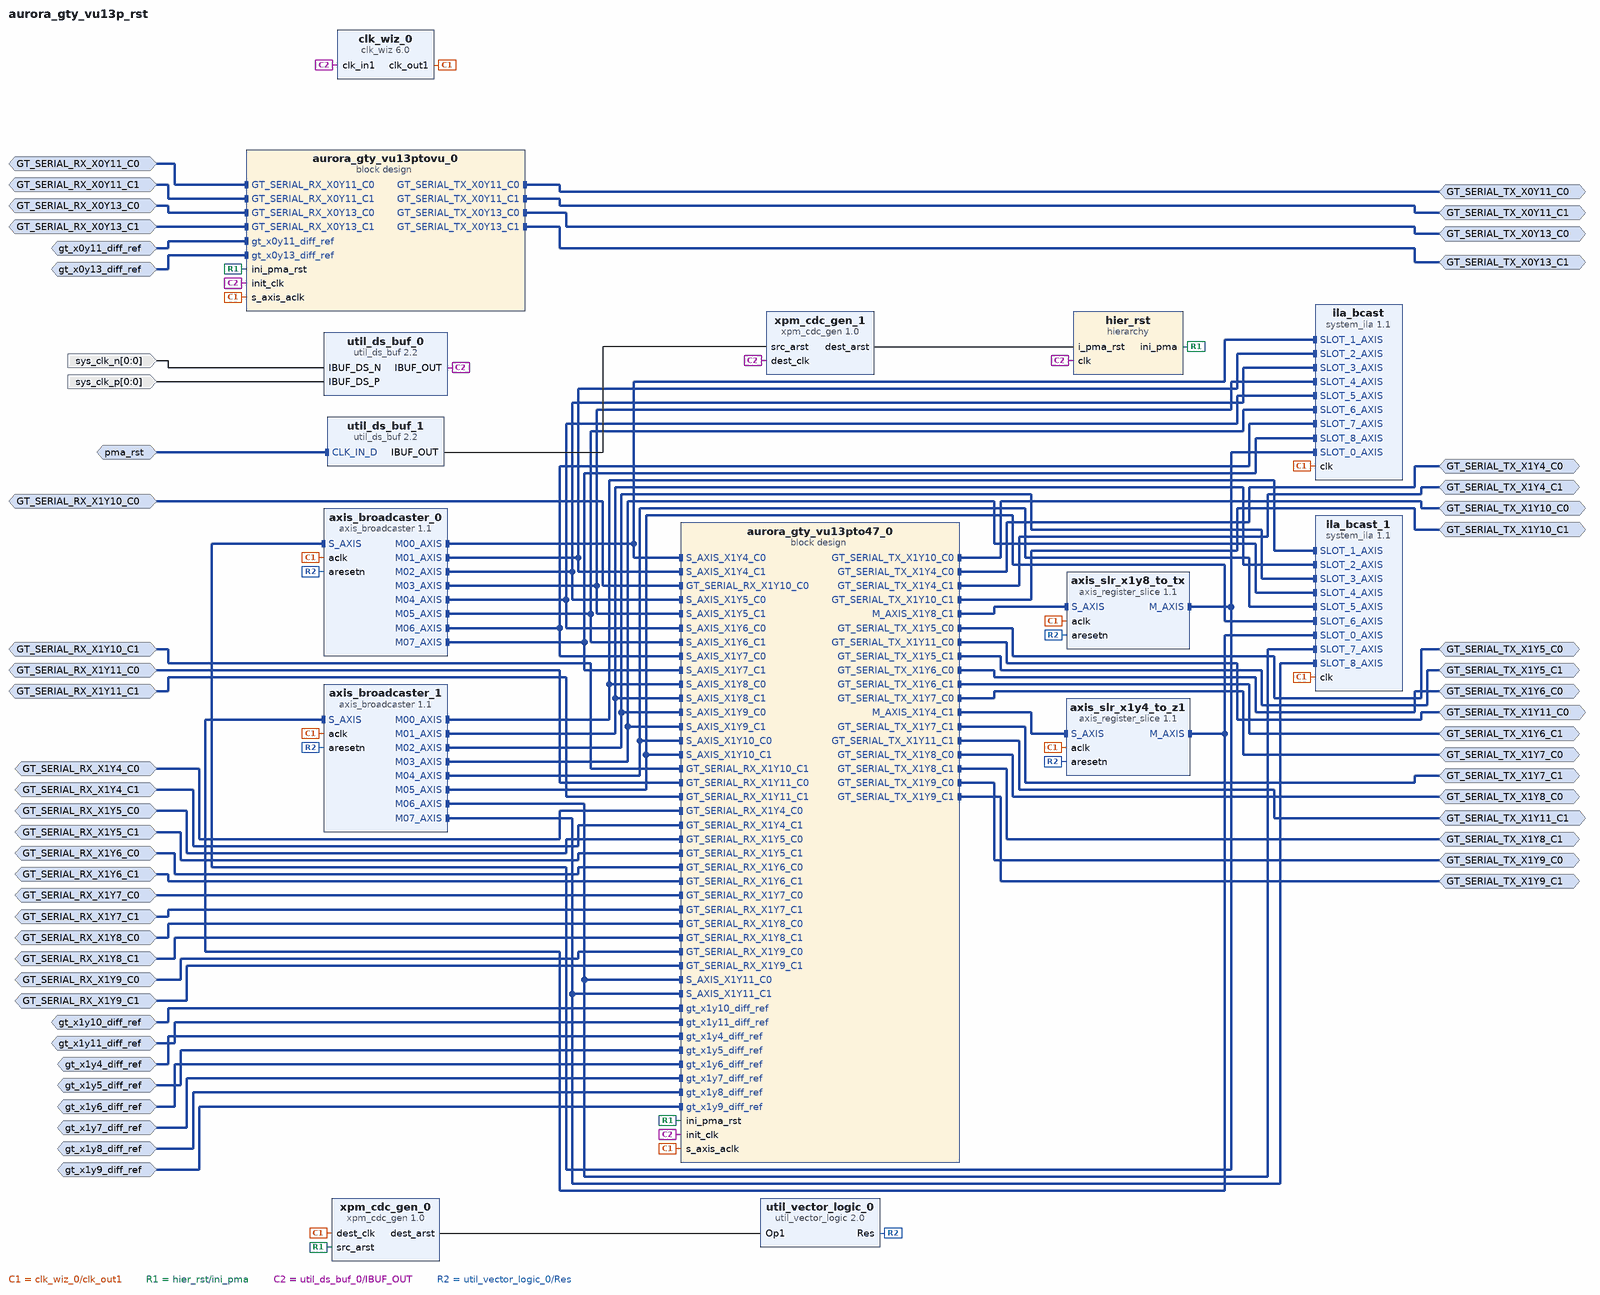
[diagram p0: block diagram of the top level]
# Vivado block design aurora_gty_vu13p_rst, xcvu13p-fhgb2104-2-i, Vivado 2025.2
create_bd_design aurora_gty_vu13p_rst

create_bd_intf_port -mode Slave -vlnv xilinx.com:interface:diff_clock_rtl:1.0 gt_x1y4_diff_ref
set_property -dict {CONFIG.FREQ_HZ 156250000} [get_bd_intf_ports gt_x1y4_diff_ref]
create_bd_intf_port -mode Slave -vlnv xilinx.com:interface:diff_clock_rtl:1.0 gt_x1y8_diff_ref
set_property -dict {CONFIG.FREQ_HZ 156250000} [get_bd_intf_ports gt_x1y8_diff_ref]
create_bd_intf_port -mode Slave -vlnv xilinx.com:display_aurora64b66b:GT_Serial_Transceiver_Pins_RX_rtl:1.0 GT_SERIAL_RX_X1Y8_C0
create_bd_intf_port -mode Slave -vlnv xilinx.com:display_aurora64b66b:GT_Serial_Transceiver_Pins_RX_rtl:1.0 GT_SERIAL_RX_X1Y4_C0
create_bd_intf_port -mode Slave -vlnv xilinx.com:display_aurora64b66b:GT_Serial_Transceiver_Pins_RX_rtl:1.0 GT_SERIAL_RX_X1Y4_C1
create_bd_intf_port -mode Master -vlnv xilinx.com:display_aurora64b66b:GT_Serial_Transceiver_Pins_TX_rtl:1.0 GT_SERIAL_TX_X1Y8_C0
create_bd_intf_port -mode Master -vlnv xilinx.com:display_aurora64b66b:GT_Serial_Transceiver_Pins_TX_rtl:1.0 GT_SERIAL_TX_X1Y4_C0
create_bd_intf_port -mode Master -vlnv xilinx.com:display_aurora64b66b:GT_Serial_Transceiver_Pins_TX_rtl:1.0 GT_SERIAL_TX_X1Y4_C1
create_bd_intf_port -mode Slave -vlnv xilinx.com:display_aurora64b66b:GT_Serial_Transceiver_Pins_RX_rtl:1.0 GT_SERIAL_RX_X0Y11_C1
create_bd_intf_port -mode Slave -vlnv xilinx.com:display_aurora64b66b:GT_Serial_Transceiver_Pins_RX_rtl:1.0 GT_SERIAL_RX_X0Y11_C0
create_bd_intf_port -mode Master -vlnv xilinx.com:display_aurora64b66b:GT_Serial_Transceiver_Pins_TX_rtl:1.0 GT_SERIAL_TX_X0Y13_C1
create_bd_intf_port -mode Master -vlnv xilinx.com:display_aurora64b66b:GT_Serial_Transceiver_Pins_TX_rtl:1.0 GT_SERIAL_TX_X0Y13_C0
create_bd_intf_port -mode Slave -vlnv xilinx.com:display_aurora64b66b:GT_Serial_Transceiver_Pins_RX_rtl:1.0 GT_SERIAL_RX_X0Y13_C0
create_bd_intf_port -mode Master -vlnv xilinx.com:display_aurora64b66b:GT_Serial_Transceiver_Pins_TX_rtl:1.0 GT_SERIAL_TX_X0Y11_C0
create_bd_intf_port -mode Slave -vlnv xilinx.com:interface:diff_clock_rtl:1.0 gt_x0y11_diff_ref
set_property -dict {CONFIG.FREQ_HZ 156250000} [get_bd_intf_ports gt_x0y11_diff_ref]
create_bd_intf_port -mode Slave -vlnv xilinx.com:display_aurora64b66b:GT_Serial_Transceiver_Pins_RX_rtl:1.0 GT_SERIAL_RX_X0Y13_C1
create_bd_intf_port -mode Master -vlnv xilinx.com:display_aurora64b66b:GT_Serial_Transceiver_Pins_TX_rtl:1.0 GT_SERIAL_TX_X0Y11_C1
create_bd_intf_port -mode Slave -vlnv xilinx.com:interface:diff_clock_rtl:1.0 gt_x0y13_diff_ref
set_property -dict {CONFIG.FREQ_HZ 156250000} [get_bd_intf_ports gt_x0y13_diff_ref]
create_bd_intf_port -mode Slave -vlnv xilinx.com:interface:diff_clock_rtl:1.0 pma_rst
create_bd_intf_port -mode Slave -vlnv xilinx.com:interface:diff_clock_rtl:1.0 gt_x1y5_diff_ref
set_property -dict {CONFIG.FREQ_HZ 156250000} [get_bd_intf_ports gt_x1y5_diff_ref]
create_bd_intf_port -mode Slave -vlnv xilinx.com:display_aurora64b66b:GT_Serial_Transceiver_Pins_RX_rtl:1.0 GT_SERIAL_RX_X1Y5_C0
create_bd_intf_port -mode Slave -vlnv xilinx.com:display_aurora64b66b:GT_Serial_Transceiver_Pins_RX_rtl:1.0 GT_SERIAL_RX_X1Y5_C1
create_bd_intf_port -mode Master -vlnv xilinx.com:display_aurora64b66b:GT_Serial_Transceiver_Pins_TX_rtl:1.0 GT_SERIAL_TX_X1Y5_C0
create_bd_intf_port -mode Master -vlnv xilinx.com:display_aurora64b66b:GT_Serial_Transceiver_Pins_TX_rtl:1.0 GT_SERIAL_TX_X1Y5_C1
create_bd_intf_port -mode Slave -vlnv xilinx.com:interface:diff_clock_rtl:1.0 gt_x1y6_diff_ref
set_property -dict {CONFIG.FREQ_HZ 156250000} [get_bd_intf_ports gt_x1y6_diff_ref]
create_bd_intf_port -mode Slave -vlnv xilinx.com:display_aurora64b66b:GT_Serial_Transceiver_Pins_RX_rtl:1.0 GT_SERIAL_RX_X1Y6_C0
create_bd_intf_port -mode Slave -vlnv xilinx.com:display_aurora64b66b:GT_Serial_Transceiver_Pins_RX_rtl:1.0 GT_SERIAL_RX_X1Y6_C1
create_bd_intf_port -mode Master -vlnv xilinx.com:display_aurora64b66b:GT_Serial_Transceiver_Pins_TX_rtl:1.0 GT_SERIAL_TX_X1Y6_C0
create_bd_intf_port -mode Master -vlnv xilinx.com:display_aurora64b66b:GT_Serial_Transceiver_Pins_TX_rtl:1.0 GT_SERIAL_TX_X1Y6_C1
create_bd_intf_port -mode Slave -vlnv xilinx.com:interface:diff_clock_rtl:1.0 gt_x1y7_diff_ref
set_property -dict {CONFIG.FREQ_HZ 156250000} [get_bd_intf_ports gt_x1y7_diff_ref]
create_bd_intf_port -mode Slave -vlnv xilinx.com:display_aurora64b66b:GT_Serial_Transceiver_Pins_RX_rtl:1.0 GT_SERIAL_RX_X1Y7_C0
create_bd_intf_port -mode Slave -vlnv xilinx.com:display_aurora64b66b:GT_Serial_Transceiver_Pins_RX_rtl:1.0 GT_SERIAL_RX_X1Y7_C1
create_bd_intf_port -mode Master -vlnv xilinx.com:display_aurora64b66b:GT_Serial_Transceiver_Pins_TX_rtl:1.0 GT_SERIAL_TX_X1Y7_C0
create_bd_intf_port -mode Master -vlnv xilinx.com:display_aurora64b66b:GT_Serial_Transceiver_Pins_TX_rtl:1.0 GT_SERIAL_TX_X1Y7_C1
create_bd_intf_port -mode Slave -vlnv xilinx.com:display_aurora64b66b:GT_Serial_Transceiver_Pins_RX_rtl:1.0 GT_SERIAL_RX_X1Y10_C0
create_bd_intf_port -mode Slave -vlnv xilinx.com:display_aurora64b66b:GT_Serial_Transceiver_Pins_RX_rtl:1.0 GT_SERIAL_RX_X1Y11_C0
create_bd_intf_port -mode Slave -vlnv xilinx.com:display_aurora64b66b:GT_Serial_Transceiver_Pins_RX_rtl:1.0 GT_SERIAL_RX_X1Y9_C0
create_bd_intf_port -mode Slave -vlnv xilinx.com:display_aurora64b66b:GT_Serial_Transceiver_Pins_RX_rtl:1.0 GT_SERIAL_RX_X1Y10_C1
create_bd_intf_port -mode Slave -vlnv xilinx.com:display_aurora64b66b:GT_Serial_Transceiver_Pins_RX_rtl:1.0 GT_SERIAL_RX_X1Y11_C1
create_bd_intf_port -mode Slave -vlnv xilinx.com:display_aurora64b66b:GT_Serial_Transceiver_Pins_RX_rtl:1.0 GT_SERIAL_RX_X1Y8_C1
create_bd_intf_port -mode Slave -vlnv xilinx.com:display_aurora64b66b:GT_Serial_Transceiver_Pins_RX_rtl:1.0 GT_SERIAL_RX_X1Y9_C1
create_bd_intf_port -mode Master -vlnv xilinx.com:display_aurora64b66b:GT_Serial_Transceiver_Pins_TX_rtl:1.0 GT_SERIAL_TX_X1Y10_C0
create_bd_intf_port -mode Master -vlnv xilinx.com:display_aurora64b66b:GT_Serial_Transceiver_Pins_TX_rtl:1.0 GT_SERIAL_TX_X1Y11_C0
create_bd_intf_port -mode Master -vlnv xilinx.com:display_aurora64b66b:GT_Serial_Transceiver_Pins_TX_rtl:1.0 GT_SERIAL_TX_X1Y9_C0
create_bd_intf_port -mode Master -vlnv xilinx.com:display_aurora64b66b:GT_Serial_Transceiver_Pins_TX_rtl:1.0 GT_SERIAL_TX_X1Y10_C1
create_bd_intf_port -mode Master -vlnv xilinx.com:display_aurora64b66b:GT_Serial_Transceiver_Pins_TX_rtl:1.0 GT_SERIAL_TX_X1Y11_C1
create_bd_intf_port -mode Master -vlnv xilinx.com:display_aurora64b66b:GT_Serial_Transceiver_Pins_TX_rtl:1.0 GT_SERIAL_TX_X1Y8_C1
create_bd_intf_port -mode Master -vlnv xilinx.com:display_aurora64b66b:GT_Serial_Transceiver_Pins_TX_rtl:1.0 GT_SERIAL_TX_X1Y9_C1
create_bd_intf_port -mode Slave -vlnv xilinx.com:interface:diff_clock_rtl:1.0 gt_x1y10_diff_ref
set_property -dict {CONFIG.FREQ_HZ 156250000} [get_bd_intf_ports gt_x1y10_diff_ref]
create_bd_intf_port -mode Slave -vlnv xilinx.com:interface:diff_clock_rtl:1.0 gt_x1y11_diff_ref
set_property -dict {CONFIG.FREQ_HZ 156250000} [get_bd_intf_ports gt_x1y11_diff_ref]
create_bd_intf_port -mode Slave -vlnv xilinx.com:interface:diff_clock_rtl:1.0 gt_x1y9_diff_ref
set_property -dict {CONFIG.FREQ_HZ 156250000} [get_bd_intf_ports gt_x1y9_diff_ref]
create_bd_port -dir I -from 0 -to 0 -type clk sys_clk_n
create_bd_port -dir I -from 0 -to 0 -type clk sys_clk_p

create_bd_cell -type hier hier_rst
create_bd_cell -type ip -vlnv xilinx.com:ip:util_ds_buf:2.2 util_ds_buf_0
create_bd_cell -type container -reference aurora_gty_vu13pto47dr aurora_gty_vu13pto47_0
set_property -dict [list \
  CONFIG.ACTIVE_SIM_BD aurora_gty_vu13pto47dr.bd \
  CONFIG.ACTIVE_SYNTH_BD aurora_gty_vu13pto47dr.bd \
  CONFIG.ENABLE_DFX 0 \
  CONFIG.LIST_SIM_BD aurora_gty_vu13pto47dr.bd \
  CONFIG.LIST_SYNTH_BD aurora_gty_vu13pto47dr.bd \
  CONFIG.LOCK_PROPAGATE 0 \
] [get_bd_cells aurora_gty_vu13pto47_0]
create_bd_cell -type ip -vlnv xilinx.com:ip:axis_broadcaster:1.1 axis_broadcaster_0
set_property -dict [list \
  CONFIG.HAS_TKEEP 1 \
  CONFIG.HAS_TLAST 1 \
  CONFIG.HAS_TREADY 0 \
  CONFIG.HAS_TSTRB 0 \
  CONFIG.M_TDATA_NUM_BYTES 16 \
  CONFIG.M_TUSER_WIDTH 0 \
  CONFIG.NUM_MI 8 \
  CONFIG.S_TDATA_NUM_BYTES 16 \
  CONFIG.S_TUSER_WIDTH 0 \
  CONFIG.TDEST_WIDTH 0 \
  CONFIG.TID_WIDTH 0 \
] [get_bd_cells axis_broadcaster_0]
create_bd_cell -type ip -vlnv xilinx.com:ip:xpm_cdc_gen:1.0 xpm_cdc_gen_0
set_property -dict {CONFIG.CDC_TYPE xpm_cdc_async_rst} [get_bd_cells xpm_cdc_gen_0]
create_bd_cell -type ip -vlnv xilinx.com:ip:util_vector_logic:2.0 util_vector_logic_0
set_property -dict {CONFIG.C_OPERATION not CONFIG.C_SIZE 1} [get_bd_cells util_vector_logic_0]
create_bd_cell -type ip -vlnv xilinx.com:ip:clk_wiz:6.0 clk_wiz_0
set_property -dict [list \
  CONFIG.CLKOUT1_JITTER 90.074 \
  CONFIG.CLKOUT1_REQUESTED_OUT_FREQ 400.000 \
  CONFIG.MMCM_CLKOUT0_DIVIDE_F 3.000 \
  CONFIG.USE_LOCKED false \
  CONFIG.USE_RESET false \
] [get_bd_cells clk_wiz_0]
create_bd_cell -type container -reference aurora_gty_vu13ptovu13p aurora_gty_vu13ptovu_0
set_property -dict [list \
  CONFIG.ACTIVE_SIM_BD aurora_gty_vu13ptovu13p.bd \
  CONFIG.ACTIVE_SYNTH_BD aurora_gty_vu13ptovu13p.bd \
  CONFIG.ENABLE_DFX 0 \
  CONFIG.LIST_SIM_BD aurora_gty_vu13ptovu13p.bd \
  CONFIG.LIST_SYNTH_BD aurora_gty_vu13ptovu13p.bd \
  CONFIG.LOCK_PROPAGATE 0 \
] [get_bd_cells aurora_gty_vu13ptovu_0]
create_bd_cell -type ip -vlnv xilinx.com:ip:util_ds_buf:2.2 util_ds_buf_1
create_bd_cell -type ip -vlnv xilinx.com:ip:xpm_cdc_gen:1.0 xpm_cdc_gen_1
set_property -dict {CONFIG.CDC_TYPE xpm_cdc_async_rst} [get_bd_cells xpm_cdc_gen_1]
create_bd_cell -type ip -vlnv xilinx.com:ip:axis_register_slice:1.1 axis_slr_x1y8_to_tx
set_property -dict [list \
  CONFIG.NUM_SLR_CROSSINGS 1 \
  CONFIG.PIPELINES_MASTER 1 \
  CONFIG.PIPELINES_SLAVE 1 \
  CONFIG.REG_CONFIG 15 \
] [get_bd_cells axis_slr_x1y8_to_tx]
create_bd_cell -type ip -vlnv xilinx.com:ip:system_ila:1.1 ila_bcast
set_property -dict [list \
  CONFIG.C_DATA_DEPTH 1024 \
  CONFIG.C_MON_TYPE INTERFACE \
  CONFIG.C_NUM_MONITOR_SLOTS 9 \
  CONFIG.C_SLOT_0_INTF_TYPE xilinx.com:interface:axis_rtl:1.0 \
  CONFIG.C_SLOT_1_INTF_TYPE xilinx.com:interface:axis_rtl:1.0 \
  CONFIG.C_SLOT_2_INTF_TYPE xilinx.com:interface:axis_rtl:1.0 \
  CONFIG.C_SLOT_3_INTF_TYPE xilinx.com:interface:axis_rtl:1.0 \
  CONFIG.C_SLOT_4_INTF_TYPE xilinx.com:interface:axis_rtl:1.0 \
  CONFIG.C_SLOT_5_INTF_TYPE xilinx.com:interface:axis_rtl:1.0 \
  CONFIG.C_SLOT_6_INTF_TYPE xilinx.com:interface:axis_rtl:1.0 \
  CONFIG.C_SLOT_7_INTF_TYPE xilinx.com:interface:axis_rtl:1.0 \
  CONFIG.C_SLOT_8_INTF_TYPE xilinx.com:interface:axis_rtl:1.0 \
] [get_bd_cells ila_bcast]
create_bd_cell -type ip -vlnv xilinx.com:ip:axis_register_slice:1.1 axis_slr_x1y4_to_z1
set_property -dict [list \
  CONFIG.NUM_SLR_CROSSINGS 1 \
  CONFIG.PIPELINES_MASTER 1 \
  CONFIG.PIPELINES_SLAVE 1 \
  CONFIG.REG_CONFIG 15 \
] [get_bd_cells axis_slr_x1y4_to_z1]
create_bd_cell -type ip -vlnv xilinx.com:ip:axis_broadcaster:1.1 axis_broadcaster_1
set_property -dict [list \
  CONFIG.HAS_TKEEP 1 \
  CONFIG.HAS_TLAST 1 \
  CONFIG.HAS_TREADY 0 \
  CONFIG.HAS_TSTRB 0 \
  CONFIG.M_TDATA_NUM_BYTES 16 \
  CONFIG.M_TUSER_WIDTH 0 \
  CONFIG.NUM_MI 8 \
  CONFIG.S_TDATA_NUM_BYTES 16 \
  CONFIG.S_TUSER_WIDTH 0 \
  CONFIG.TDEST_WIDTH 0 \
  CONFIG.TID_WIDTH 0 \
] [get_bd_cells axis_broadcaster_1]
create_bd_cell -type ip -vlnv xilinx.com:ip:system_ila:1.1 ila_bcast_1
set_property -dict [list \
  CONFIG.C_DATA_DEPTH 1024 \
  CONFIG.C_MON_TYPE INTERFACE \
  CONFIG.C_NUM_MONITOR_SLOTS 9 \
  CONFIG.C_SLOT_0_INTF_TYPE xilinx.com:interface:axis_rtl:1.0 \
  CONFIG.C_SLOT_1_INTF_TYPE xilinx.com:interface:axis_rtl:1.0 \
  CONFIG.C_SLOT_2_INTF_TYPE xilinx.com:interface:axis_rtl:1.0 \
  CONFIG.C_SLOT_3_INTF_TYPE xilinx.com:interface:axis_rtl:1.0 \
  CONFIG.C_SLOT_4_INTF_TYPE xilinx.com:interface:axis_rtl:1.0 \
  CONFIG.C_SLOT_5_INTF_TYPE xilinx.com:interface:axis_rtl:1.0 \
  CONFIG.C_SLOT_6_INTF_TYPE xilinx.com:interface:axis_rtl:1.0 \
  CONFIG.C_SLOT_7_INTF_TYPE xilinx.com:interface:axis_rtl:1.0 \
  CONFIG.C_SLOT_8_INTF_TYPE xilinx.com:interface:axis_rtl:1.0 \
] [get_bd_cells ila_bcast_1]

# ---- hierarchy /hier_rst ----
current_bd_instance /hier_rst
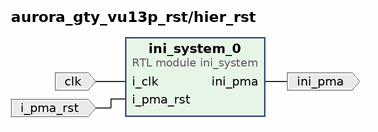
[diagram p1: block diagram inside /hier_rst]
create_bd_pin -dir I -type clk clk
create_bd_pin -dir O ini_pma
create_bd_pin -dir I -type rst i_pma_rst

create_bd_cell -type module -reference ini_system ini_system_0

# ---- connections ----

current_bd_instance /hier_rst
connect_bd_net [get_bd_pins clk] [get_bd_pins ini_system_0/i_clk]
connect_bd_net [get_bd_pins i_pma_rst] [get_bd_pins ini_system_0/i_pma_rst]
connect_bd_net [get_bd_pins ini_system_0/ini_pma] [get_bd_pins ini_pma]

current_bd_instance /
connect_bd_intf_net [get_bd_intf_ports GT_SERIAL_RX_X0Y11_C0] [get_bd_intf_pins aurora_gty_vu13ptovu_0/GT_SERIAL_RX_X0Y11_C0]
connect_bd_intf_net [get_bd_intf_ports GT_SERIAL_RX_X0Y11_C1] [get_bd_intf_pins aurora_gty_vu13ptovu_0/GT_SERIAL_RX_X0Y11_C1]
connect_bd_intf_net [get_bd_intf_ports GT_SERIAL_RX_X0Y13_C0] [get_bd_intf_pins aurora_gty_vu13ptovu_0/GT_SERIAL_RX_X0Y13_C0]
connect_bd_intf_net [get_bd_intf_ports GT_SERIAL_RX_X0Y13_C1] [get_bd_intf_pins aurora_gty_vu13ptovu_0/GT_SERIAL_RX_X0Y13_C1]
connect_bd_intf_net [get_bd_intf_ports GT_SERIAL_RX_X1Y10_C0] [get_bd_intf_pins aurora_gty_vu13pto47_0/GT_SERIAL_RX_X1Y10_C0]
connect_bd_intf_net [get_bd_intf_ports GT_SERIAL_RX_X1Y10_C1] [get_bd_intf_pins aurora_gty_vu13pto47_0/GT_SERIAL_RX_X1Y10_C1]
connect_bd_intf_net [get_bd_intf_ports GT_SERIAL_RX_X1Y11_C0] [get_bd_intf_pins aurora_gty_vu13pto47_0/GT_SERIAL_RX_X1Y11_C0]
connect_bd_intf_net [get_bd_intf_ports GT_SERIAL_RX_X1Y11_C1] [get_bd_intf_pins aurora_gty_vu13pto47_0/GT_SERIAL_RX_X1Y11_C1]
connect_bd_intf_net [get_bd_intf_ports GT_SERIAL_RX_X1Y4_C0] [get_bd_intf_pins aurora_gty_vu13pto47_0/GT_SERIAL_RX_X1Y4_C0]
connect_bd_intf_net [get_bd_intf_ports GT_SERIAL_RX_X1Y4_C1] [get_bd_intf_pins aurora_gty_vu13pto47_0/GT_SERIAL_RX_X1Y4_C1]
connect_bd_intf_net [get_bd_intf_ports GT_SERIAL_RX_X1Y5_C0] [get_bd_intf_pins aurora_gty_vu13pto47_0/GT_SERIAL_RX_X1Y5_C0]
connect_bd_intf_net [get_bd_intf_ports GT_SERIAL_RX_X1Y5_C1] [get_bd_intf_pins aurora_gty_vu13pto47_0/GT_SERIAL_RX_X1Y5_C1]
connect_bd_intf_net [get_bd_intf_ports GT_SERIAL_RX_X1Y6_C0] [get_bd_intf_pins aurora_gty_vu13pto47_0/GT_SERIAL_RX_X1Y6_C0]
connect_bd_intf_net [get_bd_intf_ports GT_SERIAL_RX_X1Y6_C1] [get_bd_intf_pins aurora_gty_vu13pto47_0/GT_SERIAL_RX_X1Y6_C1]
connect_bd_intf_net [get_bd_intf_ports GT_SERIAL_RX_X1Y7_C0] [get_bd_intf_pins aurora_gty_vu13pto47_0/GT_SERIAL_RX_X1Y7_C0]
connect_bd_intf_net [get_bd_intf_ports GT_SERIAL_RX_X1Y7_C1] [get_bd_intf_pins aurora_gty_vu13pto47_0/GT_SERIAL_RX_X1Y7_C1]
connect_bd_intf_net [get_bd_intf_ports GT_SERIAL_RX_X1Y8_C0] [get_bd_intf_pins aurora_gty_vu13pto47_0/GT_SERIAL_RX_X1Y8_C0]
connect_bd_intf_net [get_bd_intf_ports GT_SERIAL_RX_X1Y8_C1] [get_bd_intf_pins aurora_gty_vu13pto47_0/GT_SERIAL_RX_X1Y8_C1]
connect_bd_intf_net [get_bd_intf_ports GT_SERIAL_RX_X1Y9_C0] [get_bd_intf_pins aurora_gty_vu13pto47_0/GT_SERIAL_RX_X1Y9_C0]
connect_bd_intf_net [get_bd_intf_ports GT_SERIAL_RX_X1Y9_C1] [get_bd_intf_pins aurora_gty_vu13pto47_0/GT_SERIAL_RX_X1Y9_C1]
connect_bd_intf_net [get_bd_intf_pins aurora_gty_vu13pto47_0/GT_SERIAL_TX_X1Y10_C0] [get_bd_intf_ports GT_SERIAL_TX_X1Y10_C0]
connect_bd_intf_net [get_bd_intf_pins aurora_gty_vu13pto47_0/GT_SERIAL_TX_X1Y10_C1] [get_bd_intf_ports GT_SERIAL_TX_X1Y10_C1]
connect_bd_intf_net [get_bd_intf_pins aurora_gty_vu13pto47_0/GT_SERIAL_TX_X1Y11_C0] [get_bd_intf_ports GT_SERIAL_TX_X1Y11_C0]
connect_bd_intf_net [get_bd_intf_pins aurora_gty_vu13pto47_0/GT_SERIAL_TX_X1Y11_C1] [get_bd_intf_ports GT_SERIAL_TX_X1Y11_C1]
connect_bd_intf_net [get_bd_intf_pins aurora_gty_vu13pto47_0/GT_SERIAL_TX_X1Y4_C0] [get_bd_intf_ports GT_SERIAL_TX_X1Y4_C0]
connect_bd_intf_net [get_bd_intf_pins aurora_gty_vu13pto47_0/GT_SERIAL_TX_X1Y4_C1] [get_bd_intf_ports GT_SERIAL_TX_X1Y4_C1]
connect_bd_intf_net [get_bd_intf_pins aurora_gty_vu13pto47_0/GT_SERIAL_TX_X1Y5_C0] [get_bd_intf_ports GT_SERIAL_TX_X1Y5_C0]
connect_bd_intf_net [get_bd_intf_pins aurora_gty_vu13pto47_0/GT_SERIAL_TX_X1Y5_C1] [get_bd_intf_ports GT_SERIAL_TX_X1Y5_C1]
connect_bd_intf_net [get_bd_intf_pins aurora_gty_vu13pto47_0/GT_SERIAL_TX_X1Y6_C0] [get_bd_intf_ports GT_SERIAL_TX_X1Y6_C0]
connect_bd_intf_net [get_bd_intf_pins aurora_gty_vu13pto47_0/GT_SERIAL_TX_X1Y6_C1] [get_bd_intf_ports GT_SERIAL_TX_X1Y6_C1]
connect_bd_intf_net [get_bd_intf_pins aurora_gty_vu13pto47_0/GT_SERIAL_TX_X1Y7_C0] [get_bd_intf_ports GT_SERIAL_TX_X1Y7_C0]
connect_bd_intf_net [get_bd_intf_pins aurora_gty_vu13pto47_0/GT_SERIAL_TX_X1Y7_C1] [get_bd_intf_ports GT_SERIAL_TX_X1Y7_C1]
connect_bd_intf_net [get_bd_intf_pins aurora_gty_vu13pto47_0/GT_SERIAL_TX_X1Y8_C0] [get_bd_intf_ports GT_SERIAL_TX_X1Y8_C0]
connect_bd_intf_net [get_bd_intf_pins aurora_gty_vu13pto47_0/GT_SERIAL_TX_X1Y8_C1] [get_bd_intf_ports GT_SERIAL_TX_X1Y8_C1]
connect_bd_intf_net [get_bd_intf_pins aurora_gty_vu13pto47_0/GT_SERIAL_TX_X1Y9_C0] [get_bd_intf_ports GT_SERIAL_TX_X1Y9_C0]
connect_bd_intf_net [get_bd_intf_pins aurora_gty_vu13pto47_0/GT_SERIAL_TX_X1Y9_C1] [get_bd_intf_ports GT_SERIAL_TX_X1Y9_C1]
connect_bd_intf_net [get_bd_intf_pins aurora_gty_vu13pto47_0/M_AXIS_X1Y4_C1] [get_bd_intf_pins axis_slr_x1y4_to_z1/S_AXIS]
connect_bd_intf_net [get_bd_intf_pins aurora_gty_vu13pto47_0/M_AXIS_X1Y8_C1] [get_bd_intf_pins axis_slr_x1y8_to_tx/S_AXIS]
connect_bd_intf_net [get_bd_intf_pins aurora_gty_vu13ptovu_0/GT_SERIAL_TX_X0Y11_C0] [get_bd_intf_ports GT_SERIAL_TX_X0Y11_C0]
connect_bd_intf_net [get_bd_intf_pins aurora_gty_vu13ptovu_0/GT_SERIAL_TX_X0Y11_C1] [get_bd_intf_ports GT_SERIAL_TX_X0Y11_C1]
connect_bd_intf_net [get_bd_intf_pins aurora_gty_vu13ptovu_0/GT_SERIAL_TX_X0Y13_C0] [get_bd_intf_ports GT_SERIAL_TX_X0Y13_C0]
connect_bd_intf_net [get_bd_intf_pins aurora_gty_vu13ptovu_0/GT_SERIAL_TX_X0Y13_C1] [get_bd_intf_ports GT_SERIAL_TX_X0Y13_C1]
connect_bd_intf_net [get_bd_intf_pins axis_broadcaster_0/M00_AXIS] [get_bd_intf_pins aurora_gty_vu13pto47_0/S_AXIS_X1Y4_C0]
connect_bd_intf_net [get_bd_intf_pins axis_broadcaster_0/M00_AXIS] [get_bd_intf_pins ila_bcast/SLOT_1_AXIS]
connect_bd_intf_net [get_bd_intf_pins axis_broadcaster_0/M01_AXIS] [get_bd_intf_pins aurora_gty_vu13pto47_0/S_AXIS_X1Y4_C1]
connect_bd_intf_net [get_bd_intf_pins axis_broadcaster_0/M01_AXIS] [get_bd_intf_pins ila_bcast/SLOT_2_AXIS]
connect_bd_intf_net [get_bd_intf_pins axis_broadcaster_0/M02_AXIS] [get_bd_intf_pins aurora_gty_vu13pto47_0/S_AXIS_X1Y5_C0]
connect_bd_intf_net [get_bd_intf_pins axis_broadcaster_0/M02_AXIS] [get_bd_intf_pins ila_bcast/SLOT_3_AXIS]
connect_bd_intf_net [get_bd_intf_pins axis_broadcaster_0/M03_AXIS] [get_bd_intf_pins aurora_gty_vu13pto47_0/S_AXIS_X1Y5_C1]
connect_bd_intf_net [get_bd_intf_pins axis_broadcaster_0/M03_AXIS] [get_bd_intf_pins ila_bcast/SLOT_4_AXIS]
connect_bd_intf_net [get_bd_intf_pins axis_broadcaster_0/M04_AXIS] [get_bd_intf_pins aurora_gty_vu13pto47_0/S_AXIS_X1Y6_C0]
connect_bd_intf_net [get_bd_intf_pins axis_broadcaster_0/M04_AXIS] [get_bd_intf_pins ila_bcast/SLOT_5_AXIS]
connect_bd_intf_net [get_bd_intf_pins axis_broadcaster_0/M05_AXIS] [get_bd_intf_pins aurora_gty_vu13pto47_0/S_AXIS_X1Y6_C1]
connect_bd_intf_net [get_bd_intf_pins axis_broadcaster_0/M05_AXIS] [get_bd_intf_pins ila_bcast/SLOT_6_AXIS]
connect_bd_intf_net [get_bd_intf_pins axis_broadcaster_0/M06_AXIS] [get_bd_intf_pins aurora_gty_vu13pto47_0/S_AXIS_X1Y7_C0]
connect_bd_intf_net [get_bd_intf_pins axis_broadcaster_0/M06_AXIS] [get_bd_intf_pins ila_bcast/SLOT_7_AXIS]
connect_bd_intf_net [get_bd_intf_pins axis_broadcaster_0/M07_AXIS] [get_bd_intf_pins aurora_gty_vu13pto47_0/S_AXIS_X1Y7_C1]
connect_bd_intf_net [get_bd_intf_pins axis_broadcaster_0/M07_AXIS] [get_bd_intf_pins ila_bcast/SLOT_8_AXIS]
connect_bd_intf_net [get_bd_intf_pins axis_broadcaster_1/M00_AXIS] [get_bd_intf_pins aurora_gty_vu13pto47_0/S_AXIS_X1Y8_C0]
connect_bd_intf_net [get_bd_intf_pins axis_broadcaster_1/M00_AXIS] [get_bd_intf_pins ila_bcast_1/SLOT_1_AXIS]
connect_bd_intf_net [get_bd_intf_pins axis_broadcaster_1/M01_AXIS] [get_bd_intf_pins aurora_gty_vu13pto47_0/S_AXIS_X1Y8_C1]
connect_bd_intf_net [get_bd_intf_pins axis_broadcaster_1/M01_AXIS] [get_bd_intf_pins ila_bcast_1/SLOT_2_AXIS]
connect_bd_intf_net [get_bd_intf_pins axis_broadcaster_1/M02_AXIS] [get_bd_intf_pins aurora_gty_vu13pto47_0/S_AXIS_X1Y9_C0]
connect_bd_intf_net [get_bd_intf_pins axis_broadcaster_1/M02_AXIS] [get_bd_intf_pins ila_bcast_1/SLOT_3_AXIS]
connect_bd_intf_net [get_bd_intf_pins axis_broadcaster_1/M03_AXIS] [get_bd_intf_pins aurora_gty_vu13pto47_0/S_AXIS_X1Y9_C1]
connect_bd_intf_net [get_bd_intf_pins axis_broadcaster_1/M03_AXIS] [get_bd_intf_pins ila_bcast_1/SLOT_4_AXIS]
connect_bd_intf_net [get_bd_intf_pins axis_broadcaster_1/M04_AXIS] [get_bd_intf_pins aurora_gty_vu13pto47_0/S_AXIS_X1Y10_C0]
connect_bd_intf_net [get_bd_intf_pins axis_broadcaster_1/M04_AXIS] [get_bd_intf_pins ila_bcast_1/SLOT_5_AXIS]
connect_bd_intf_net [get_bd_intf_pins axis_broadcaster_1/M05_AXIS] [get_bd_intf_pins aurora_gty_vu13pto47_0/S_AXIS_X1Y10_C1]
connect_bd_intf_net [get_bd_intf_pins axis_broadcaster_1/M05_AXIS] [get_bd_intf_pins ila_bcast_1/SLOT_6_AXIS]
connect_bd_intf_net [get_bd_intf_pins axis_broadcaster_1/M06_AXIS] [get_bd_intf_pins aurora_gty_vu13pto47_0/S_AXIS_X1Y11_C0]
connect_bd_intf_net [get_bd_intf_pins axis_broadcaster_1/M06_AXIS] [get_bd_intf_pins ila_bcast_1/SLOT_7_AXIS]
connect_bd_intf_net [get_bd_intf_pins axis_broadcaster_1/M07_AXIS] [get_bd_intf_pins aurora_gty_vu13pto47_0/S_AXIS_X1Y11_C1]
connect_bd_intf_net [get_bd_intf_pins axis_broadcaster_1/M07_AXIS] [get_bd_intf_pins ila_bcast_1/SLOT_8_AXIS]
connect_bd_intf_net [get_bd_intf_pins axis_slr_x1y4_to_z1/M_AXIS] [get_bd_intf_pins axis_broadcaster_1/S_AXIS]
connect_bd_intf_net [get_bd_intf_pins axis_slr_x1y4_to_z1/M_AXIS] [get_bd_intf_pins ila_bcast_1/SLOT_0_AXIS]
connect_bd_intf_net [get_bd_intf_pins axis_slr_x1y8_to_tx/M_AXIS] [get_bd_intf_pins axis_broadcaster_0/S_AXIS]
connect_bd_intf_net [get_bd_intf_pins axis_slr_x1y8_to_tx/M_AXIS] [get_bd_intf_pins ila_bcast/SLOT_0_AXIS]
connect_bd_intf_net [get_bd_intf_ports gt_x0y11_diff_ref] [get_bd_intf_pins aurora_gty_vu13ptovu_0/gt_x0y11_diff_ref]
connect_bd_intf_net [get_bd_intf_ports gt_x0y13_diff_ref] [get_bd_intf_pins aurora_gty_vu13ptovu_0/gt_x0y13_diff_ref]
connect_bd_intf_net [get_bd_intf_ports gt_x1y10_diff_ref] [get_bd_intf_pins aurora_gty_vu13pto47_0/gt_x1y10_diff_ref]
connect_bd_intf_net [get_bd_intf_ports gt_x1y11_diff_ref] [get_bd_intf_pins aurora_gty_vu13pto47_0/gt_x1y11_diff_ref]
connect_bd_intf_net [get_bd_intf_ports gt_x1y4_diff_ref] [get_bd_intf_pins aurora_gty_vu13pto47_0/gt_x1y4_diff_ref]
connect_bd_intf_net [get_bd_intf_ports gt_x1y5_diff_ref] [get_bd_intf_pins aurora_gty_vu13pto47_0/gt_x1y5_diff_ref]
connect_bd_intf_net [get_bd_intf_ports gt_x1y6_diff_ref] [get_bd_intf_pins aurora_gty_vu13pto47_0/gt_x1y6_diff_ref]
connect_bd_intf_net [get_bd_intf_ports gt_x1y7_diff_ref] [get_bd_intf_pins aurora_gty_vu13pto47_0/gt_x1y7_diff_ref]
connect_bd_intf_net [get_bd_intf_ports gt_x1y8_diff_ref] [get_bd_intf_pins aurora_gty_vu13pto47_0/gt_x1y8_diff_ref]
connect_bd_intf_net [get_bd_intf_ports gt_x1y9_diff_ref] [get_bd_intf_pins aurora_gty_vu13pto47_0/gt_x1y9_diff_ref]
connect_bd_intf_net [get_bd_intf_ports pma_rst] [get_bd_intf_pins util_ds_buf_1/CLK_IN_D]
connect_bd_net [get_bd_pins clk_wiz_0/clk_out1] \
  [get_bd_pins aurora_gty_vu13pto47_0/s_axis_aclk] [get_bd_pins xpm_cdc_gen_0/dest_clk] [get_bd_pins axis_broadcaster_0/aclk] \
  [get_bd_pins aurora_gty_vu13ptovu_0/s_axis_aclk] [get_bd_pins axis_slr_x1y8_to_tx/aclk] [get_bd_pins ila_bcast/clk] \
  [get_bd_pins axis_slr_x1y4_to_z1/aclk] [get_bd_pins axis_broadcaster_1/aclk] [get_bd_pins ila_bcast_1/clk]
connect_bd_net [get_bd_pins hier_rst/ini_pma] \
  [get_bd_pins xpm_cdc_gen_0/src_arst] [get_bd_pins aurora_gty_vu13pto47_0/ini_pma_rst] \
  [get_bd_pins aurora_gty_vu13ptovu_0/ini_pma_rst]
connect_bd_net [get_bd_ports sys_clk_n] [get_bd_pins util_ds_buf_0/IBUF_DS_N]
connect_bd_net [get_bd_ports sys_clk_p] [get_bd_pins util_ds_buf_0/IBUF_DS_P]
connect_bd_net [get_bd_pins util_ds_buf_0/IBUF_OUT] \
  [get_bd_pins hier_rst/clk] [get_bd_pins aurora_gty_vu13pto47_0/init_clk] [get_bd_pins clk_wiz_0/clk_in1] \
  [get_bd_pins aurora_gty_vu13ptovu_0/init_clk] [get_bd_pins xpm_cdc_gen_1/dest_clk]
connect_bd_net [get_bd_pins util_ds_buf_1/IBUF_OUT] [get_bd_pins xpm_cdc_gen_1/src_arst]
connect_bd_net [get_bd_pins util_vector_logic_0/Res] \
  [get_bd_pins axis_broadcaster_0/aresetn] [get_bd_pins axis_slr_x1y8_to_tx/aresetn] \
  [get_bd_pins axis_slr_x1y4_to_z1/aresetn] [get_bd_pins axis_broadcaster_1/aresetn]
connect_bd_net [get_bd_pins xpm_cdc_gen_0/dest_arst] [get_bd_pins util_vector_logic_0/Op1]
connect_bd_net [get_bd_pins xpm_cdc_gen_1/dest_arst] [get_bd_pins hier_rst/i_pma_rst]

validate_bd_design
save_bd_design
